# Altium project VA_meter.PrjPcb
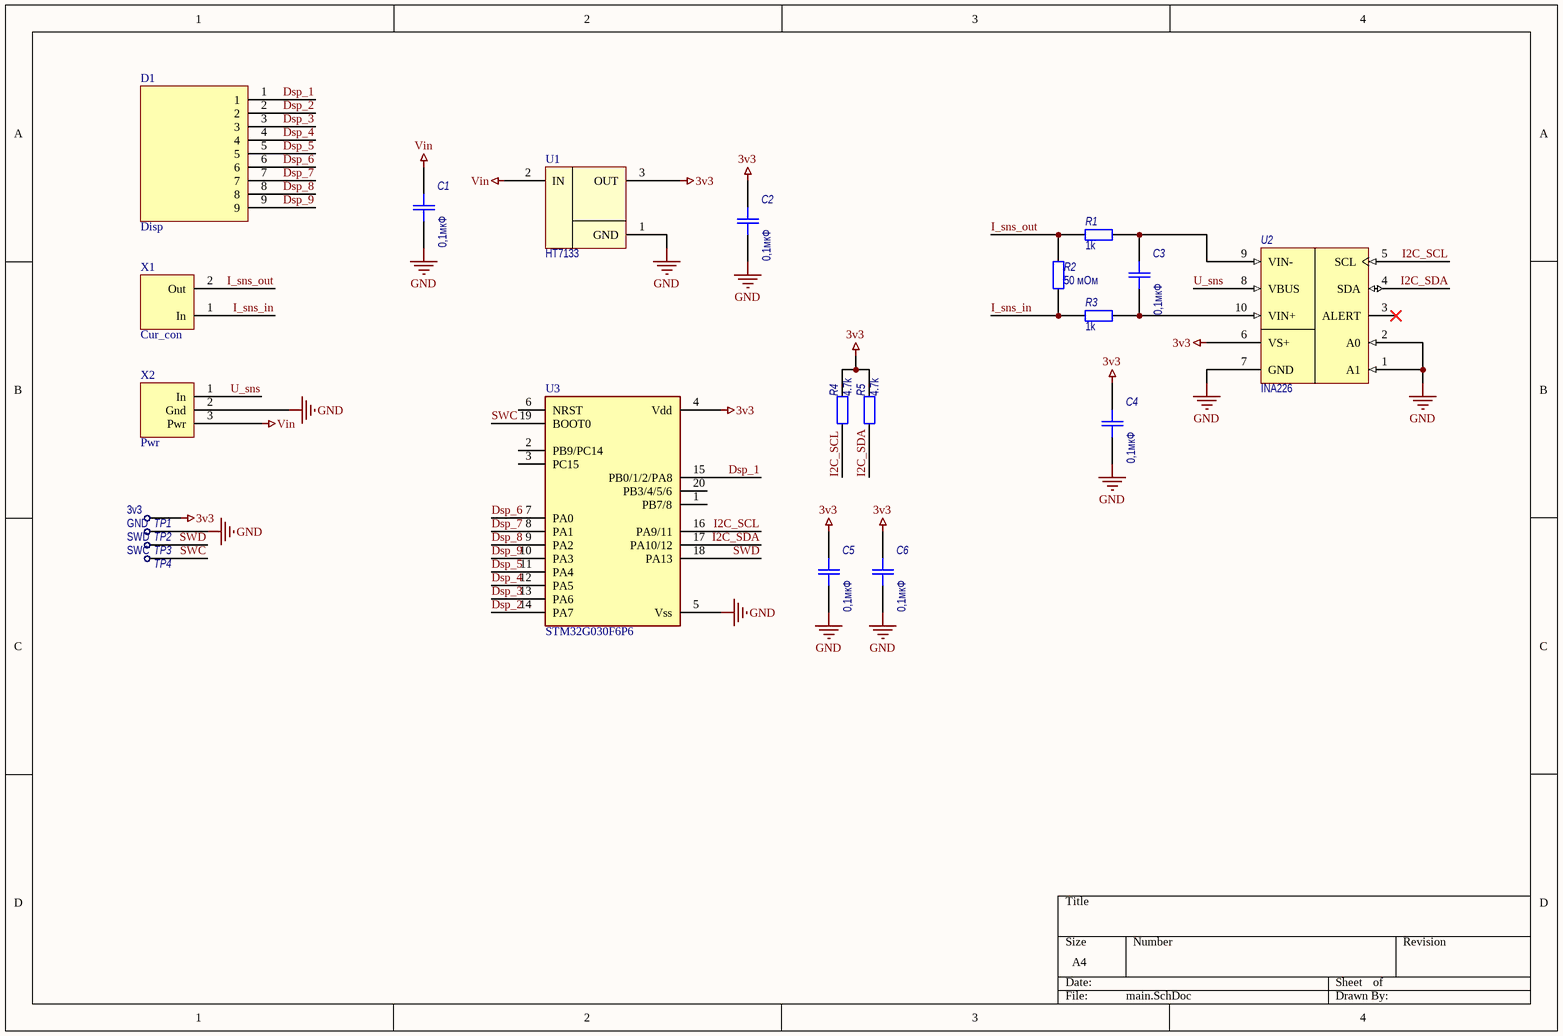
[diagram p0: main.SchDoc]
1 sheet, 21 parts. Net scope: global (net labels, ports and power ports of the same name join across sheets).
Board file: main.PcbDoc

## Sheet main.SchDoc
size A4; SheetNumber: 1; SheetTotal: 1

### Parts
C1  value 0,1мкФ  [SMD_C0603]  (hidden comment: K10-79)
C2  value 0,1мкФ  [SMD_C0603]  (hidden comment: K10-79)
C3  value 0,1мкФ  [SMD_C0603]  (hidden comment: K10-79)
C4  value 0,1мкФ  [SMD_C0603]  (hidden comment: K10-79)
C5  value 0,1мкФ  [SMD_C0603]  (hidden comment: K10-79)
C6  value 0,1мкФ  [SMD_C0603]  (hidden comment: K10-79)
D1  Disp  [Disp_7x6_seg]
R1  value 1k  [SMD_0603]  (hidden comment: OSM R1-8)
R2  value 50 мОм  [SMD_1206]  (hidden comment: OSM R1-8)
R3  value 1k  [SMD_0603]  (hidden comment: OSM R1-8)
R4  value 4.7k  [SMD_0603]  (hidden comment: OSM R1-8)
R5  value 4.7k  [SMD_0603]  (hidden comment: OSM R1-8)
TP1  3v3  [TP_PAD_1]
TP2  GND  [TP_PAD_1]
TP3  SWD  [TP_PAD_1]
TP4  SWC  [TP_PAD_1]
U1  HT7133  [SOT89]
U2  INA226  [VSSOP-10]
U3  STM32G030F6P6  [TSSOP_20]
X1  Cur_con  [Cur_con]
X2  Pwr  [Pwr_con]

### Nets
3v3: C2.2 C4.2 C5.2 C6.2 R4.1 R5.1 TP1.0(TP) U1.3(OUT) U2.6(VS+) U3.4(Vdd)
GND: C1.1 C2.1 C4.1 C5.1 C6.1 TP2.0(TP) U1.1(GND) U2.1(A1) U2.2(A0) U2.7(GND) U3.5(Vss) X2.2(Gnd)
Vin: C1.2 U1.2(IN) X2.3(Pwr)
Dsp_1: D1.1 U3.15(PB0/1/2/PA8)
Dsp_2: D1.2 U3.14(PA7)
Dsp_3: D1.3 U3.13(PA6)
Dsp_4: D1.4 U3.12(PA5)
Dsp_5: D1.5 U3.11(PA4)
Dsp_6: D1.6 U3.7(PA0)
Dsp_7: D1.7 U3.8(PA1)
Dsp_8: D1.8 U3.9(PA2)
Dsp_9: D1.9 U3.10(PA3)
I2C_SCL: R4.2 U2.5(SCL) U3.16(PA9/11)
I2C_SDA: R5.2 U2.4(SDA) U3.17(PA10/12)
I_sns_in: R2.1 R3.2 X1.1(In)
I_sns_out: R1.2 R2.2 X1.2(Out)
SWC: TP4.0(TP) U3.19(BOOT0)
SWD: TP3.0(TP) U3.18(PA13)
U_sns: U2.8(VBUS) X2.1(In)
NetC3_1: C3.1 R3.1 U2.10(VIN+)
NetC3_2: C3.2 R1.1 U2.9(VIN-)

Not connected (* = marked no-connect by the designer): U2 3(ALERT)*; U3 1(PB7/8) 2(PB9/PC14) 3(PC15) 6(NRST) 20(PB3/4/5/6)

### Library data of the parts
C1-C6 = Capacitor: Назначение: SMD-конденсатор; Наименование: К10-79; Потребление, Вт: 0; Точность: %; Напряжение: В; Диэлектрик: *
R1-R5 = Resistor: Наименование: ОСМ Р1-12; Назначение: SMD-резистор; Потребление, Вт: 0,001; Точность: %
TP1-TP4 = TP: Наименование: Точка проверки; Назначение: Контроль параметров платы
  TP1: TP_Name: 3v3
  TP2: TP_Name: GND
  TP3: TP_Name: SWD
  TP4: TP_Name: SWC
U1 = HT7133: Low-drop linear regulator; Назначение: Линейный регулятор; Потребление, Вт: 0,100; ComponentLink1Description: DataSheet; ComponentLink1URL: https://www.radiant.su/files/images/Kremhij-marketing/1278EP1T.pdf; Наименование: HT7133
U2 = INA226: High- or Low-Side Measurement, Bidirectional Current and Power Monitor With I2C Interface; Назначение: High-Side or Low-Side Measurement,; Потребление, Вт: 0,001; ComponentLink1Description: Data sheet; ComponentLink1URL: http://www.ti.com/lit/ds/symlink/ina226.pdf; DataSheet: https://www.ti.com/lit/ds/symlink/ina226.pdf?ts=1592809211957&ref_url=https%253A%252F%252Fwww.google.com%252F; Наименование: INA226
U3 = STM32G030F6P6: 32-bit ARM Cortex-M0 MCU; Price: None; Package: TSSOP-20; Value: *